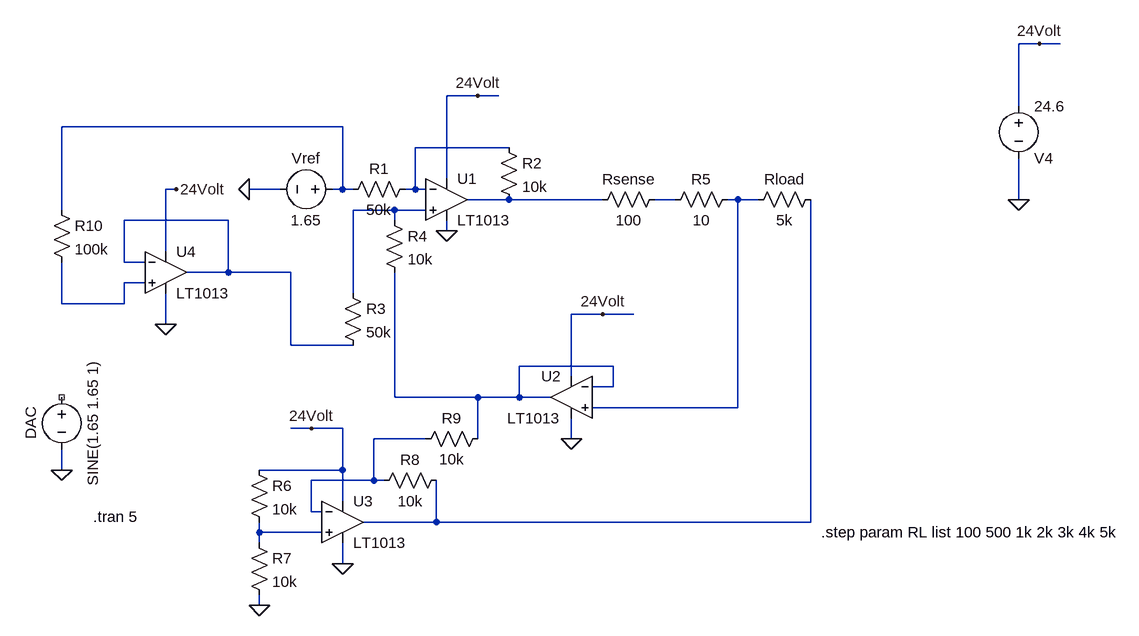
[diagram p0: schematic Howland_Pump.asc]
Howland_Pump.asc, the LTspice schematic file:
Version 4.1
SHEET 1 1172 788
WIRE 1008 -96 976 -96
WIRE 1040 -96 1008 -96
WIRE 144 -16 96 -16
WIRE 176 -16 144 -16
WIRE 976 0 976 -96
WIRE -64 32 -496 32
WIRE 192 64 48 64
WIRE 96 112 96 -16
WIRE -320 128 -336 128
WIRE -160 128 -208 128
WIRE -64 128 -64 32
WIRE -64 128 -80 128
WIRE -48 128 -64 128
WIRE 48 128 48 64
WIRE 48 128 32 128
WIRE 64 128 48 128
WIRE 192 144 128 144
WIRE 336 144 192 144
WIRE 448 144 416 144
WIRE 544 144 528 144
WIRE 576 144 544 144
WIRE 976 144 976 80
WIRE -496 160 -496 32
WIRE 16 160 -48 160
WIRE 64 160 16 160
WIRE -240 176 -400 176
WIRE 16 176 16 160
WIRE 96 192 96 176
WIRE -336 224 -336 128
WIRE -400 240 -400 176
WIRE -368 240 -400 240
WIRE -240 256 -240 176
WIRE -240 256 -304 256
WIRE -144 256 -240 256
WIRE -368 272 -400 272
WIRE -48 288 -48 160
WIRE -496 304 -496 240
WIRE -400 304 -400 272
WIRE -400 304 -496 304
WIRE 336 320 288 320
WIRE 384 320 336 320
WIRE -336 336 -336 288
WIRE -144 368 -144 256
WIRE -48 368 -144 368
WIRE 352 400 208 400
WIRE 288 416 288 320
WIRE 352 432 352 400
WIRE 352 432 320 432
WIRE 16 448 16 256
WIRE 144 448 16 448
WIRE 208 448 208 400
WIRE 208 448 144 448
WIRE 256 448 208 448
WIRE 544 464 544 144
WIRE 544 464 320 464
WIRE -112 496 -144 496
WIRE -64 496 -112 496
WIRE 64 512 -16 512
WIRE 144 512 144 448
WIRE 288 512 288 480
WIRE -496 560 -496 528
WIRE -64 560 -64 496
WIRE -64 560 -192 560
WIRE -16 576 -16 512
WIRE -16 576 -112 576
WIRE 0 576 -16 576
WIRE -64 608 -64 560
WIRE -112 624 -112 576
WIRE -96 624 -112 624
WIRE 80 640 80 576
WIRE 80 640 -32 640
WIRE 656 640 656 144
WIRE 656 640 80 640
WIRE -192 656 -192 640
WIRE -96 656 -192 656
WIRE -192 672 -192 656
WIRE -64 704 -64 672
WIRE -192 768 -192 752
FLAG 96 192 0
FLAG -208 128 0
FLAG 288 512 0
FLAG -496 560 0
FLAG -64 704 0
FLAG -192 768 0
FLAG -320 128 24Volt
FLAG 976 144 0
FLAG 1008 -96 24Volt
FLAG 144 -16 24Volt
FLAG 336 320 24Volt
FLAG -112 496 24Volt
FLAG -336 336 0
SYMBOL res 48 112 R90
WINDOW 0 0 56 VBottom 2
WINDOW 3 32 56 VTop 2
SYMATTR InstName R1
SYMATTR Value 50k
SYMBOL res 176 48 R0
SYMATTR InstName R2
SYMATTR Value 10k
SYMBOL res 432 128 R90
WINDOW 0 0 56 VBottom 2
WINDOW 3 32 56 VTop 2
SYMATTR InstName Rsense
SYMATTR Value 100
SYMBOL res -64 272 R0
SYMATTR InstName R3
SYMATTR Value 50k
SYMBOL res 0 160 R0
SYMATTR InstName R4
SYMATTR Value 10k
SYMBOL res 672 128 R90
WINDOW 0 0 56 VBottom 2
WINDOW 3 32 56 VTop 2
SYMATTR InstName Rload
SYMATTR Value 5k
SYMBOL voltage -64 128 R90
WINDOW 0 -32 56 VBottom 2
WINDOW 3 32 56 VTop 2
WINDOW 123 0 0 Left 0
WINDOW 39 0 0 Left 0
SYMATTR InstName Vref
SYMATTR Value 1.65
SYMBOL voltage -496 432 R0
WINDOW 0 -32 56 VBottom 2
WINDOW 3 32 56 VTop 2
WINDOW 123 0 0 Left 0
WINDOW 39 0 0 Left 0
SYMATTR InstName DAC
SYMATTR Value SINE(1.65 1.65 1)
SYMBOL OpAmps\\LT1013 96 80 R0
SYMATTR InstName U1
SYMBOL OpAmps\\LT1013 288 384 M0
SYMATTR InstName U2
SYMBOL res 544 128 R90
WINDOW 0 0 56 VBottom 2
WINDOW 3 32 56 VTop 2
SYMATTR InstName R5
SYMATTR Value 10
SYMBOL OpAmps\\LT1013 -64 576 R0
SYMATTR InstName U3
SYMBOL res -208 544 R0
SYMATTR InstName R6
SYMATTR Value 10k
SYMBOL res -208 656 R0
SYMATTR InstName R7
SYMATTR Value 10k
SYMBOL res 96 560 R90
WINDOW 0 0 56 VBottom 2
WINDOW 3 32 56 VTop 2
SYMATTR InstName R8
SYMATTR Value 10k
SYMBOL res 160 496 R90
WINDOW 0 0 56 VBottom 2
WINDOW 3 32 56 VTop 2
SYMATTR InstName R9
SYMATTR Value 10k
SYMBOL OpAmps\\LT1013 -336 192 R0
SYMATTR InstName U4
SYMBOL res -512 144 R0
SYMATTR InstName R10
SYMATTR Value 100k
SYMBOL voltage 976 -16 R0
WINDOW 0 24 96 Left 2
WINDOW 3 24 16 Left 2
WINDOW 123 0 0 Left 0
WINDOW 39 0 0 Left 0
SYMATTR InstName V4
SYMATTR Value 24.6
TEXT 672 656 Left 2 !.step param RL list 100 500 1k 2k 3k 4k 5k
TEXT -448 632 Left 2 !.tran 5

The netlist it stands for:
* Howland_Pump.asc
R1 N002 N001 50k
R2 N002 N003 10k
Rsense N004 N003 100
R3 N006 N007 50k
R4 N006 N009 10k
Rload N011 N005 5k
Vref N001 0 1.65
V§DAC NC_01 0 SINE(1.65 1.65 1)
X§U1 N006 N002 24Volt 0 N003 LT1013  ; pins In+ In- V+ V- OUT
X§U2 N005 N009 24Volt 0 N009 LT1013  ; pins In+ In- V+ V- OUT
R5 N005 N004 10
X§U3 N012 N010 24Volt 0 N011 LT1013  ; pins In+ In- V+ V- OUT
R6 24Volt N012 10k
R7 N012 0 10k
R8 N011 N010 10k
R9 N009 N010 10k
X§U4 N008 N007 24Volt 0 N007 LT1013  ; pins In+ In- V+ V- OUT
R10 N001 N008 100k
V4 24Volt 0 24.6
.step param RL list 100 500 1k 2k 3k 4k 5k
.tran 5
.lib LTC.lib
.backanno
.end